# Altium project RF_Tetra.PrjPcb (part 4 of 7)

## Sheet RF_ANT.SchDoc: Antenna
size A3; SheetNumber: 13; SheetTotal: 17
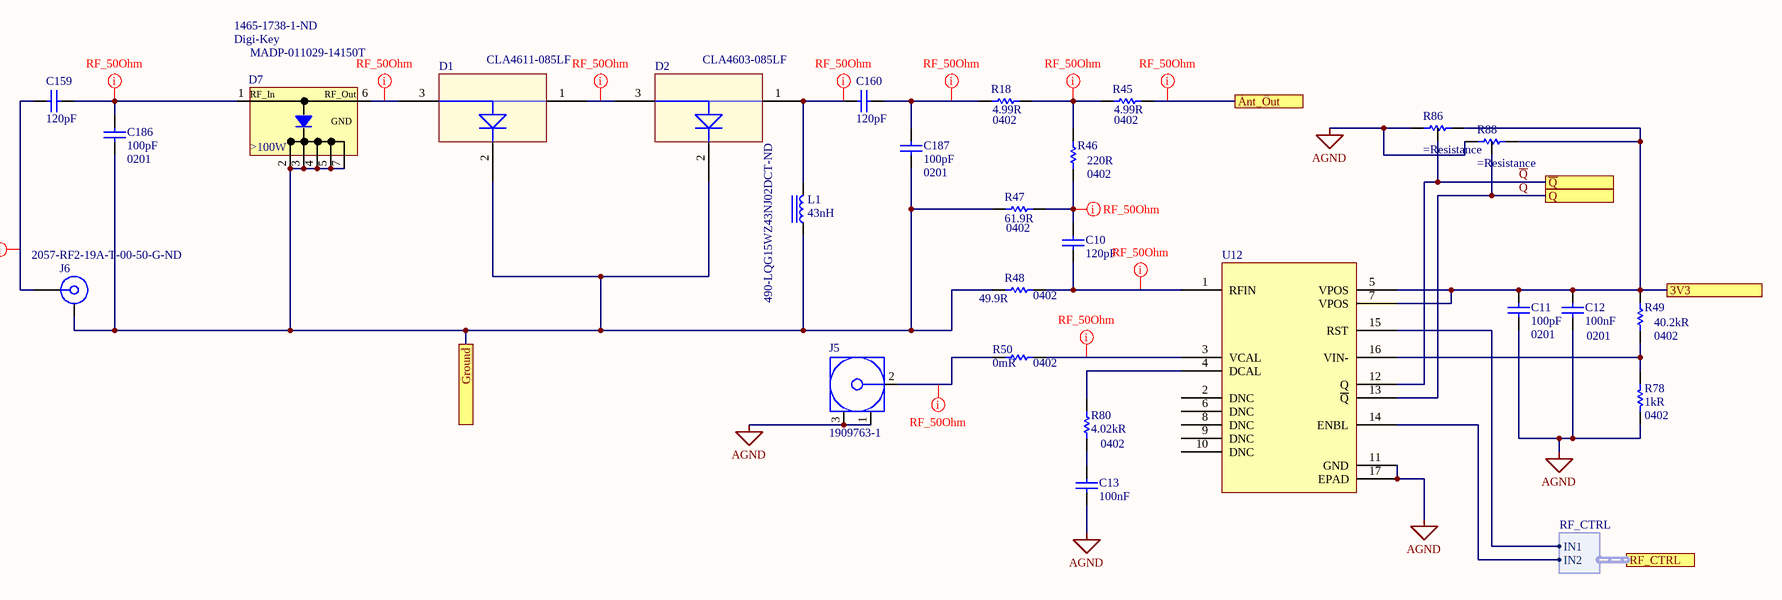
[diagram p8: RF_ANT.SchDoc]

### Parts
(Parts that share a designator on the sheet are numbered #1, #2 ... from top to bottom, then left to right.)
C10#2  120pF  [CAP 0402/1005 RF KK]
C11#2  100pF  Case/Package: 0201  [CAP 0201/0603 KK]
C12#2  100nF  Case/Package: 0201  [CAP 0201/0603 KK]
C13#2  100nF  [CAP 0201/0603 KK]
C159  120pF  [CAP 0402/1005 RF KK]
C160  120pF  [CAP 0402/1005 RF KK]
C186  100pF  Case/Package: 0201  [CAP 0201/0603 KK]
C187  100pF  Case/Package: 0201  [CAP 0201/0603 KK]
D1  CLA4611-085LF  [CLA4611-085LF]
D2  CLA4603-085LF  [CLA4611-085LF]
D7  MADP-011029-14150T  Supplier 1: Digi-Key  Supplier Part Number 1: 1465-1738-1-ND  [ODS-1415]
J5  1909763-1  [TECO-1909763-1_V]
J6  Supplier Part Number 1: 2057-RF2-19A-T-00-50-G-ND  [ROS-32K101-400L5_V]  (hidden comment: 32K101-400L5)
L1  43nH  Supplier Part Number 1: 490-LQG15WZ43NJ02DCT-ND  [IND 0402/1005 RF WW]
R18  4.99R  Case/Package: 0402  [RES 0402/1005 RF KK]
R45  4.99R  Case/Package: 0402  [RES 0402/1005 RF KK]
R46  220R  Case/Package: 0402  [RES 0402/1005 RF KK]
R47  61.9R  Case/Package: 0402  [RES 0402/1005 RF KK]
R48  49.9R  Case/Package: 0402  [RES 0402/1005 RF KK]
R49  40.2kR  Case/Package: 0402  [RES 0402/1005 RF KK]
R50  0mR  Case/Package: 0402  [RES 0402/1005 RF KK]
R78  1kR  Case/Package: 0402  [RES 0402/1005 RF KK]
R80  4.02kR  Case/Package: 0402  [RES 0402/1005 RF KK]
R86  (no value)  [RES 0402/1005 RF - 3-PADS]
R88  (no value)  [RES 0402/1005 RF - 3-PADS]
U12  ADL5910ACPZN-R7  [ADL5910]  (value not drawn)

### Ports
3V3, Ant_Out, Ground, Q, RF_CTRL (harness RF_CTRL), ~{Q}

### Harnesses
RF_CTRL: IN1, IN2

### Nets
AGND: C11#2.2 C12#2.1 C13#2.1 C186.1 C187.1 D1.2(GND) D2.2(GND) D7.2(GND) D7.3(GND) D7.4(GND) D7.5(GND) D7.7(GND) J5.1 J5.3 J6.MH L1.1 R47.1 R48.2 R78.2 R86.2 R88.2 U12.11(GND) U12.17(EPAD) ; port Ground  [project net GND_ATT]
3V3_DIGIT: C11#2.1 C12#2.2 R49.2 R86.1 R88.1 U12.5(VPOS) U12.7(VPOS) ; port 3V3
EN_RF_P_1: U12.14(ENBL) ; port RF_CTRL.IN2
Q: R88.3 U12.13(~{Q}) ; port Q
~{Q}: R86.3 U12.12(Q) ; port ~{Q}
RST_RF_P_1: U12.15(RST) ; port RF_CTRL.IN1
NetC10#2_1: C10#2.1 R48.1 U12.1(RFIN)
NetC10#2_2: C10#2.2 R46.2 R47.2
NetC13#2_2: C13#2.2 R80.1
NetC159_1: C159.1 J6.1
NetC159_2: C159.2 C186.2 D7.1(RF_In)
NetC160_1: C160.1 D2.1 L1.2
NetC160_2: C160.2 C187.2 R18.1
NetD1_1: D1.1 D2.3
NetD1_3: D1.3 D7.6(RF_Out)
NetJ5_2: J5.2 R50.1
NetR18_2: R18.2 R45.1 R46.1
NetR45_2: R45.2 ; port Ant_Out
NetR49_1: R49.1 R78.1 U12.16(VIN-)
NetR50_2: R50.2 U12.3(VCAL)
NetR80_2: R80.2 U12.4(DCAL)

Not connected (* = marked no-connect by the designer): U12 2(DNC) 6(DNC) 8(DNC) 9(DNC) 10(DNC)

### Layout directives
net class Single50: NetC10#2_1, NetC10#2_2, NetC159_1, NetC159_2, NetC160_1, NetC160_2, NetD1_1, NetD1_3, NetJ5_2, NetR18_2, NetR45_2, NetR50_2

### Notes on the sheet
- Title
- Size:
- Date:
- A3
- Number:
- Time:
- Revision:
- Sheet
- of
- File:
- (in symbol MADP-011029-14150T) >100W

### Library data of the parts
C10#2 C159 C160 = Capacitor: CAP CER 120PF 25V C0G/NP0 0402; Manufacturer: KEMET; Manufacturer Part Number: C0402C121J3GAC7867; Tolerance: 5%; Supplier 1: Digi-Key; Supplier Part Number 1: 399-14880-1-ND; RoHS: No; Category: Ceramic Capacitors; Stock 1: 43311; Pricing 1: 1=0,10000, 10=0,04100, 50=0,02260, 100=0,01840, 500=0,01312, 1000=0,01032, 2500=0,00938, 5000=0,00863 (USD); Mount: Surface Mount; Case/Package: 0402; Case Code (Imperial): 0402; Case Code (Metric): 1005; Min Operating Temperature: -55°C; Max Operating Temperature: 125°C; Packaging: Tape and Reel; Capacitance: 120pF; Voltage Rating: 25V; ComponentLink1URL: https://api.kemet.com/component-edge/download/datasheet/C0402C121J3GAC7867.pdf?src-supplier=Digi-Key; ComponentLink1Description: https://api.kemet.com/component-edge/download/datasheet/C0402C121J3GAC7867.pdf?src-supplier=Digi-Key
C11#2 C186 C187 = Capacitor: Multilayer Ceramic Capacitors MLCC - SMD/SMT 0201 100pF 25volts C0G +/-5%; Manufacturer: Murata; Manufacturer Part Number: GRM0335C1E101JA01D; Tolerance: 5%; Voltage: 25V; Supplier 1: Digi-Key; Supplier Part Number 1: 490-3160-1-ND; RoHS: Yes; Category: Ceramic Capacitors; Stock 1: 270262; Pricing 1: 1=0,10000, 10=0,01300, 100=0,00560, 500=0,00400, 1000=0,00315, 2500=0,00286, 5000=0,00263 (USD); Mount: Surface Mount; Case Code (Metric): 0603; Case Code (Imperial): 0201; Min Operating Temperature: -55°C; Max Operating Temperature: 125°C; Dielectric: C0G; Capacitance: 100pF; Termination: SMD/SMT; Package Quantity: 15000; Packaging: Tape and Reel; Voltage Rating: 25V; Voltage Rating (DC): 25V; Length: 0.6mm; Height: 0.3mm; Thickness: 0.013inch; Depth: 0.3mm; Width: 0.012inch; Radiation Hardening: No; REACH SVHC: No SVHC; Lead Free: Lead Free; ComponentLink1URL: https://datasheet.ciiva.com/16497/grm0335c1e101ja01-01-16497112.pdf?src-supplier=Future+Electronics; ComponentLink1Description: https://datasheet.ciiva.com/16497/grm0335c1e101ja01-01-16497112.pdf?src-supplier=Future+Electronics; ComponentLink2URL: https://datasheet.ciiva.com/18697/product-18697797.pdf?src-supplier=Digi-Key; ComponentLink2Description: https://datasheet.ciiva.com/18697/product-18697797.pdf?src-supplier=Digi-Key
C12#2 C13#2 = Capacitor: Manufacturer 1: Murata; Manufacturer Part Number 1: GRM033R61C104ME84D; Voltage Rating: 16V; Tolerance: 20%; Dielectric: X5R; Supplier 1: Digi-Key; Supplier Part Number 1: 490-9986-1-ND; Stock 1: 503570; Pricing 1: 1=0.10000, 10=0.05400, 100=0.02430, 500=0.01732, 1000=0.01361, 2500=0.01238, 5000=0.01139 (USD); RoHS: Yes; Mount: Surface Mount; Weight: 1.2E-05oz; Case Code (Metric): 0603; Case Code (Imperial): 0201; Min Operating Temperature: -55°C; Max Operating Temperature: 85°C; Capacitance: 100nF; Packaging: Tape and Reel; Termination: SMD/SMT; Voltage Rating (DC): 16V; Package Quantity: 15000; Length: 0.024inch; Height: 0.3mm; Width: 0.3mm; Thickness: 0.013inch; ComponentLink1URL: http://www.mouser.com/ds/2/281/c02e-2905.pdf?src-supplier=Mouser; ComponentLink1Description: http://www.mouser.com/ds/2/281/c02e-2905.pdf?src-supplier=Mouser; ComponentLink2URL: http://search.murata.co.jp/Ceramy/image/img/A01X/G101/ENG/GRM033R61C104ME84-01.pdf?src-supplier=Digi-Key; ComponentLink2Description: http://search.murata.co.jp/Ceramy/image/img/A01X/G101/ENG/GRM033R61C104ME84-01.pdf?src-supplier=Digi-Key
  C13#2: Case/Package: 0201
D1 = CLA4611-085LF: Diode PIN 180V 1500mA 3-Pin QFN EP T/R; Manufacturer: Skyworks Solutions; Diode Type: PIN - Single; Max Current Rating: 1.5A; Max Power Dissipation: 2W; Supplier 1: Digi-Key; Manufacturer Part Number: CLA4611-085LF; RoHS: Yes; Category: Diodes; Stock 1: 1259; Pricing 1: 1=2,06000, 10=1,85200, 25=1,74760, 100=1,48890, 250=1,39800, 500=1,22326, 1000=1,01355 (USD); Case/Package: QFN; Packaging: Tape and Reel; ComponentLink1URL: http://www.mouser.com/ds/2/472/CLA4611_085LF_203346B-1079479.pdf?src-supplier=Mouser; ComponentLink1Description: http://www.mouser.com/ds/2/472/CLA4611_085LF_203346B-1079479.pdf?src-supplier=Mouser; ComponentLink2URL: http://www.skyworksinc.com/uploads/documents/CLA4611_085LF_203346B.pdf?src-supplier=Digi-Key; ComponentLink2Description: http://www.skyworksinc.com/uploads/documents/CLA4611_085LF_203346B.pdf?src-supplier=Digi-Key
D2 = CLA4603-085LF: DIODE RF PIN 45V 1.5A 3QFN; Manufacturer: Skyworks Solutions; Diode Type: PIN - Single; Power Dissipation: 30W; Max Power Dissipation: 2W; Element Configuration: Common Anode; Supplier 1: Digi-Key; Manufacturer Part Number: CLA4603-085LF; RoHS: Yes; Category: Diodes; Stock 1: 32861; Pricing 1: 1=2,06000, 10=1,85200, 25=1,74760, 100=1,48890, 250=1,39800, 500=1,22326, 1000=1,01355 (USD); Mount: Surface Mount; Case/Package: QFN; Number of Pins: 3; Min Operating Temperature: -40°C; Max Operating Temperature: 150°C; Termination: SMD/SMT; Max Current Rating: 1.5A; Reverse Voltage (DC): 45V; Packaging: Tape and Reel; Package Quantity: 3000; Forward Current: 1.5A; Radiation Hardening: No; Lead Free: Lead Free; ComponentLink1URL: https://datasheet.ciiva.com/15224/getdatasheetpartid-729048-15224693.pdf?src-supplier=Verical; ComponentLink1Description: https://datasheet.ciiva.com/15224/getdatasheetpartid-729048-15224693.pdf?src-supplier=Verical
J5 = 1909763-1: Ultra Miniature Coaxial Connector Jack, 60 V, 50 Ohm, -40 to 90 degC, RoHS, Tape and Reel; Brand: TE Connectivity / AMP; Maximum Frequency: 6 GHz; Gender: Jack (Female); Body Material: Liquid Crystal Polymer (LCP); RF Series: UMCC; Impedance: 50 Ohms; DatasheetVersion: Rev. B2; PackageReference: SMD; PackageDescription: 3-Pin Surface Mount Device, Body 2.6 x 2.6 mm; Supplier 1: Newark; Supplier Part Number 1: 62X0488; Supplier 2: Farnell; Supplier Part Number 2: 2781689; Supplier 3: Digi-Key; Supplier Part Number 3: A118077TR-ND; Supplier 4: Digi-Key; Supplier Part Number 4: A118077CT-ND; Supplier 5: Digi-Key; Supplier Part Number 5: A118077DKR-ND; Product Category: RF Connectors / Coaxial Connectors; Packaging: Reel; Product: Connectors; Orientation: Straight; Operating Temperature Range: - 40 C to + 90 C; Factory Pack Quantity: 5000; RoHS: Details; Contact Plating: Gold; Contact Material: Copper Alloy; Mounting Technology: Surface Mount; ComponentLink1Description: Manufacturer URL; ComponentLink1URL: http://www.te.com; ComponentLink2Description: Datasheet; ComponentLink2URL: http://www.te.com/commerce/DocumentDelivery/DDEController?Action=srchrtrv&DocNm=1909763&DocType=Customer+Drawing&DocLang=English
J6 = 32K101-400L5: SMA Straight Jack, Up to 18 GHz, -55 to 155 degC; Manufacturer: Adam Equipment; Manufacturer Part Number: RF2-19A-T-00-50-G; Supplier 1: Digi-Key; RoHS: No; Stock 1: 329; Pricing 1: 1=2,90000, 10=2,78800, 25=2,55520, 50=2,43920, 100=2,32300, 250=2,03264, 500=1,97456, 1000=1,68418, 2500=1,56802 (USD)
L1 = IND_WW: Inductor Chip 43nH 5% 2-Pin 0402 Paper T/R; Manufacturer: Murata; Manufacturer Part Number: LQG15WZ43NJ02D; Supplier 1: Digi-Key; Stock 1: 10000; Pricing 1: 1=0,13000, 10=0,11700, 25=0,10400, 50=0,08840, 100=0,07800, 250=0,07152, 500=0,06500, 1000=0,05460, 2500=0,04680 (USD); ComponentLink1URL: http://datasheet.octopart.com/LQG15WZ43NJ02D-Murata-datasheet-138753957.pdf?src-supplier=Ciiva+Crawler; ComponentLink1Description: http://datasheet.octopart.com/LQG15WZ43NJ02D-Murata-datasheet-138753957.pdf?src-supplier=Ciiva+Crawler; ComponentLink2URL: http://datasheet.octopart.com/LQG15WZ43NJ02D-Murata-datasheet-140712826.pdf?src-supplier=Ciiva+Crawler; ComponentLink2Description: http://datasheet.octopart.com/LQG15WZ43NJ02D-Murata-datasheet-140712826.pdf?src-supplier=Ciiva+Crawler; ComponentLink3URL: http://datasheet.octopart.com/LQG15WZ43NJ02D-Murata-datasheet-141286732.pdf?src-supplier=Ciiva+Crawler; ComponentLink3Description: http://datasheet.octopart.com/LQG15WZ43NJ02D-Murata-datasheet-141286732.pdf?src-supplier=Ciiva+Crawler; ComponentLink4URL: http://datasheet.octopart.com/LQG15WZ43NJ02D-Murata-datasheet-145449678.pdf?src-supplier=Geoflip; ComponentLink4Description: http://datasheet.octopart.com/LQG15WZ43NJ02D-Murata-datasheet-145449678.pdf?src-supplier=Geoflip
R18 R45 = Resistor: RES SMD 4.99 OHM 1% 1/16W 0402; Manufacturer: Vishay; Manufacturer Part Number: CRCW04024R99FKEDC; Max Power Dissipation: 63mW; Temperature Coefficient: 100ppm/°C; Supplier 1: Digi-Key; Supplier Part Number 1: 541-4085-1-ND; RoHS: No; Stock 1: 341364; Pricing 1: 1=0,10000, 10=0,09300, 100=0,03580, 1000=0,01573, 2500=0,01358, 5000=0,01216 (USD); Case Code (Imperial): 0402; Case Code (Metric): 1005; Min Operating Temperature: -55°C; Max Operating Temperature: 155°C; Composition: Thick Film; Packaging: Tape and Reel; Resistance: 4.99R; Tolerance: 1%; Number of Terminations: 2; ComponentLink1URL: http://www.vishay.com/docs/28773/crcwce3.pdf?src-supplier=Digi-Key; ComponentLink1Description: http://www.vishay.com/docs/28773/crcwce3.pdf?src-supplier=Digi-Key
R46 = Resistor: TE CONNECTIVITY - CRGP0402F220R - SMD Chip Resistor, 0402 [1005 Metric], 220 ohm, CRGP Series, 50 V, Thick Film, 125 mW; Tolerance: 1%; Max Power Dissipation: 125mW; Temperature Coefficient: 100ppm/°C; Supplier 1: Digi-Key; Supplier Part Number 1: A130347CT-ND; Manufacturer: TE Connectivity; Manufacturer Part Number: CRGP0402F220R; RoHS: No; Category: Chip SMD Resistors; Stock 1: 193172; Pricing 1: 1=0,10000, 10=0,08400, 100=0,03230, 1000=0,01421, 2500=0,01228, 5000=0,01098 (USD); Min Operating Temperature: -55°C; Max Operating Temperature: 155°C; Resistor Type: Thick Film; Packaging: Tape and Reel; Resistance: 220R; Number of Terminations: 2; ComponentLink1URL: https://www.te.com/commerce/DocumentDelivery/DDEController?Action=srchrtrv&DocNm=9-1773463-9&DocType=DS&DocLang=English&src-supplier=Digi-Key; ComponentLink1Description: https://www.te.com/commerce/DocumentDelivery/DDEController?Action=srchrtrv&DocNm=9-1773463-9&DocType=DS&DocLang=English&src-supplier=Digi-Key; ComponentLink2URL: https://4donline.ihs.com/images/VipMasterIC/IC/TYEL/TYEL-S-A0005460475/TYEL-S-A0005460475-1.pdf?hkey=52A5661711E402568146F3353EA87419&src-supplier=Farnell; ComponentLink2Description: https://4donline.ihs.com/images/VipMasterIC/IC/TYEL/TYEL-S-A0005460475/TYEL-S-A0005460475-1.pdf?hkey=52A5661711E402568146F3353EA87419&src-supplier=Farnell; ComponentLink3URL: https://4donline.ihs.com/images/VipMasterIC/IC/TYEL/TYEL-S-A0005460475/TYEL-S-A0005460475-1.pdf?hkey=52A5661711E402568146F3353EA87419&src-supplier=Newark; ComponentLink3Description: https://4donline.ihs.com/images/VipMasterIC/IC/TYEL/TYEL-S-A0005460475/TYEL-S-A0005460475-1.pdf?hkey=52A5661711E402568146F3353EA87419&src-supplier=Newark
R47 = Resistor: RES SMD 61.9 OHM 1% 1/16W 0402; Manufacturer: Yageo; Manufacturer Part Number: RC0402FR-0761R9L; Power Rating: 62.5mW; Voltage Rating: 50V; Temperature Coefficient: 100ppm/°C; Max Power Dissipation: 63mW; Supplier 1: Digi-Key; Supplier Part Number 1: 311-61.9LRCT-ND; RoHS: Yes; Category: Chip SMD Resistors; Stock 1: 87319; Pricing 1: 1=0,10000, 10=0,01400, 100=0,00580, 1000=0,00262, 2500=0,00228, 5000=0,00188 (USD); Case Code (Imperial): 0402; Case Code (Metric): 1005; Contact Plating: Tin,Matte,Lead; Min Operating Temperature: -55°C; Max Operating Temperature: 155°C; Package Quantity: 1; Resistance: 61.9R; Tolerance: 1%; Packaging: Tape and Reel; Termination: SMD/SMT; Resistor Type: Thick Film; Number of Terminations: 2; Voltage Rating (DC): 50V; Working Voltage: 50V; Features: Moisture Resistant; Length: 1mm; Width: 0.5mm; Height: 0.016inch; Depth: 0.5mm; Radiation Hardening: No; Military Standard: Not; Lead Free: Lead Free; ComponentLink1URL: https://datasheet.ciiva.com/16741/pyu-rc0402-51-rohs-l-6-r-16741941.pdf?src-supplier=Future+Electronics; ComponentLink1Description: https://datasheet.ciiva.com/16741/pyu-rc0402-51-rohs-l-6-r-16741941.pdf?src-supplier=Future+Electronics; ComponentLink2URL: https://datasheet.ciiva.com/15189/getdatasheetpartid-325045-15189495.pdf?src-supplier=Verical; ComponentLink2Description: https://datasheet.ciiva.com/15189/getdatasheetpartid-325045-15189495.pdf?src-supplier=Verical; ComponentLink3URL: https://datasheet.ciiva.com/2453/pyu-r-int-thick-7-2453706.pdf?src-supplier=Digi-Key; ComponentLink3Description: https://datasheet.ciiva.com/2453/pyu-r-int-thick-7-2453706.pdf?src-supplier=Digi-Key; ComponentLink4URL: https://datasheet.ciiva.com/2453/pyu-r-int-thick-7-2453707.pdf?src-supplier=Digi-Key; ComponentLink4Description: https://datasheet.ciiva.com/2453/pyu-r-int-thick-7-2453707.pdf?src-supplier=Digi-Key; ComponentLink5URL: https://datasheet.ciiva.com/16867/pyu-rc0402-51-rohs-l-6-16867419.pdf?src-supplier=Avnet+Europe; ComponentLink5Description: https://datasheet.ciiva.com/16867/pyu-rc0402-51-rohs-l-6-16867419.pdf?src-supplier=Avnet+Europe; ComponentLink6URL: https://datasheet.ciiva.com/2453/pyu-r-int-thick-7-2453708.pdf?src-supplier=Digi-Key; ComponentLink6Description: https://datasheet.ciiva.com/2453/pyu-r-int-thick-7-2453708.pdf?src-supplier=Digi-Key; ComponentLink7URL: https://datasheet.ciiva.com/28397/pyu-rc0402-51-rohs-l-6-28397965.pdf?src-supplier=Avnet+Europe; ComponentLink7Description: https://datasheet.ciiva.com/28397/pyu-rc0402-51-rohs-l-6-28397965.pdf?src-supplier=Avnet+Europe; ComponentLink8URL: https://datasheet.ciiva.com/8888/pyu-rc0402-51-rohs-l-6-8888591.pdf?src-supplier=Avnet; ComponentLink8Description: https://datasheet.ciiva.com/8888/pyu-rc0402-51-rohs-l-6-8888591.pdf?src-supplier=Avnet
R48 = Resistor: SUSUMU - RR0510R-49R9-D - RES, THIN FILM, 49R9, 0.5%, 0.0625W, 0402; Voltage Rating (DC): 25V; Power Rating: 62.5mW; Temperature Coefficient: 100ppm/°C; Supplier 1: Digi-Key; Supplier Part Number 1: RR05R49.9DCT-ND; Manufacturer: Susumu; Manufacturer Part Number: RR0510R-49R9-D; RoHS: Yes; Category: Chip SMD Resistors; Stock 1: 493315; Pricing 1: 1=0,10000, 10=0,07200, 100=0,02910, 1000=0,01309, 2500=0,01136, 5000=0,00939 (USD); Number of Pins: 2; Case Code (Imperial): 0402; Case Code (Metric): 1005; Min Operating Temperature: -55°C; Max Operating Temperature: 125°C; Tolerance: 0.5%; Packaging: Tape and Reel; Resistance: 49.9R; Voltage Rating: 25V; Termination: SMD/SMT; Resistor Type: Thin Film; Length: 1mm; Width: 0.5mm; Height: 0.35mm; Lead Free: Lead Free; REACH SVHC: Unknown; ComponentLink1URL: https://datasheet.ciiva.com/7984/1581132-7984319.pdf?src-supplier=Element14; ComponentLink1Description: https://datasheet.ciiva.com/7984/1581132-7984319.pdf?src-supplier=Element14
R49 = Resistor: Res Thick Film 0402 40.2K Ohm 1% 1/16W ±100ppm/°C Molded SMD Paper T/R; Manufacturer: Yageo; Manufacturer Part Number: RC0402FR-0740K2L; Power Rating: 62.5mW; Voltage Rating: 50V; Max Power Dissipation: 63mW; Supplier 1: Digi-Key; Supplier Part Number 1: 311-40.2KLRCT-ND; RoHS: Yes; Category: Chip SMD Resistors; Stock 1: 625093; Pricing 1: 1=0,10000, 10=0,01400, 100=0,00580, 1000=0,00262, 2500=0,00228, 5000=0,00188 (USD); Case Code (Metric): 1005; Case Code (Imperial): 0402; Contact Plating: Tin,Matte; Min Operating Temperature: -55°C; Max Operating Temperature: 155°C; Package Quantity: 1; Resistance: 40.2kR; Tolerance: 1%; Packaging: Tape and Reel; Resistor Type: Thick Film; Number of Terminations: 2; Termination: SMD/SMT; Temperature Coefficient: 100ppm/°C; Features: Moisture Resistant; Voltage Rating (DC): 50V; Length: 0.039inch; Width: 0.02inch; Height: 0.016inch; Depth: 0.5mm; Military Standard: Not; Lead Free: Lead Free; ComponentLink1URL: https://datasheet.ciiva.com/8889/pyu-rc0402-51-rohs-l-6-8889263.pdf?src-supplier=Avnet; ComponentLink1Description: https://datasheet.ciiva.com/8889/pyu-rc0402-51-rohs-l-6-8889263.pdf?src-supplier=Avnet; ComponentLink2URL: https://datasheet.ciiva.com/16857/pyu-rc0402-51-rohs-l-6-16857071.pdf?src-supplier=Avnet+Europe; ComponentLink2Description: https://datasheet.ciiva.com/16857/pyu-rc0402-51-rohs-l-6-16857071.pdf?src-supplier=Avnet+Europe; ComponentLink3URL: https://datasheet.ciiva.com/28400/pyu-rc0402-51-rohs-l-6-28400199.pdf?src-supplier=Avnet+Europe; ComponentLink3Description: https://datasheet.ciiva.com/28400/pyu-rc0402-51-rohs-l-6-28400199.pdf?src-supplier=Avnet+Europe; ComponentLink4URL: https://datasheet.ciiva.com/2453/pyu-r-int-thick-7-2453436.pdf?src-supplier=Digi-Key; ComponentLink4Description: https://datasheet.ciiva.com/2453/pyu-r-int-thick-7-2453436.pdf?src-supplier=Digi-Key; ComponentLink5URL: https://datasheet.ciiva.com/2453/pyu-r-int-thick-7-2453437.pdf?src-supplier=Digi-Key; ComponentLink5Description: https://datasheet.ciiva.com/2453/pyu-r-int-thick-7-2453437.pdf?src-supplier=Digi-Key; ComponentLink6URL: https://datasheet.ciiva.com/5557/pyu-rc0402-51-rohs-l-6-r-5557981.pdf?src-supplier=Mouser; ComponentLink6Description: https://datasheet.ciiva.com/5557/pyu-rc0402-51-rohs-l-6-r-5557981.pdf?src-supplier=Mouser; ComponentLink7URL: https://datasheet.ciiva.com/2453/pyu-r-int-thick-7-2453438.pdf?src-supplier=Digi-Key; ComponentLink7Description: https://datasheet.ciiva.com/2453/pyu-r-int-thick-7-2453438.pdf?src-supplier=Digi-Key; ComponentLink8URL: https://datasheet.ciiva.com/16744/pyu-rc0402-51-rohs-l-6-r-16744286.pdf?src-supplier=Future+Electronics; ComponentLink8Description: https://datasheet.ciiva.com/16744/pyu-rc0402-51-rohs-l-6-r-16744286.pdf?src-supplier=Future+Electronics
R50 = Resistor: YAGEO - RC0402JR-070RL. - RES, THICK FILM, 0R, 0.0625W, 0402; Power Rating: 62.5mW; Tolerance: 5%; Voltage Rating: 50V; Max Power Dissipation: 63mW; Temperature Coefficient: 200ppm/°C; Supplier 1: Digi-Key; Supplier Part Number 1: 311-0.0JRCT-ND; Manufacturer: Yageo; Manufacturer Part Number: RC0402JR-070RL; RoHS: Yes; Category: Chip SMD Resistors; Stock 1: 45338179; Pricing 1: 1=0,10000, 10=0,01200, 25=0,00920, 50=0,00680, 100=0,00510, 250=0,00388, 500=0,00310, 1000=0,00228, 5000=0,00163 (USD); Case Code (Metric): 1005; Case Code (Imperial): 0402; Contact Plating: Tin,Matte; Min Operating Temperature: -55°C; Max Operating Temperature: 155°C; Package Quantity: 1; Resistance: 0mR; Packaging: Tape and Reel; Resistor Type: Thick Film; Number of Terminations: 2; Termination: SMD/SMT; Features: Moisture Resistant; Length: 1mm; Height: 0.016inch; Width: 0.02inch; Depth: 0.5mm; Radiation Hardening: No; REACH SVHC: Unknown; Military Standard: Not; Lead Free: Lead Free; ComponentLink1URL: https://datasheet.ciiva.com/2452/pyu-rc0402-51-rohs-l-6-2452608.pdf?src-supplier=Digi-Key; ComponentLink1Description: https://datasheet.ciiva.com/2452/pyu-rc0402-51-rohs-l-6-2452608.pdf?src-supplier=Digi-Key; ComponentLink2URL: https://datasheet.ciiva.com/11808/0900766b80c66297-11808195.pdf?src-supplier=RSComponents; ComponentLink2Description: https://datasheet.ciiva.com/11808/0900766b80c66297-11808195.pdf?src-supplier=RSComponents; ComponentLink3URL: https://datasheet.ciiva.com/2452/pyu-r-int-thick-7-2452609.pdf?src-supplier=Digi-Key; ComponentLink3Description: https://datasheet.ciiva.com/2452/pyu-r-int-thick-7-2452609.pdf?src-supplier=Digi-Key; ComponentLink4URL: https://datasheet.ciiva.com/2452/pyu-r-int-thick-7-2452610.pdf?src-supplier=Digi-Key; ComponentLink4Description: https://datasheet.ciiva.com/2452/pyu-r-int-thick-7-2452610.pdf?src-supplier=Digi-Key; ComponentLink5URL: https://datasheet.ciiva.com/8896/pyu-rc0402-51-rohs-l-6-8896201.pdf?src-supplier=Avnet; ComponentLink5Description: https://datasheet.ciiva.com/8896/pyu-rc0402-51-rohs-l-6-8896201.pdf?src-supplier=Avnet; ComponentLink6URL: https://datasheet.ciiva.com/28386/pyu-rc0402-51-rohs-l-6-28386633.pdf?src-supplier=Avnet+Europe; ComponentLink6Description: https://datasheet.ciiva.com/28386/pyu-rc0402-51-rohs-l-6-28386633.pdf?src-supplier=Avnet+Europe; ComponentLink7URL: https://datasheet.ciiva.com/22747/1018594-22747515.pdf?src-supplier=Element14; ComponentLink7Description: https://datasheet.ciiva.com/22747/1018594-22747515.pdf?src-supplier=Element14; ComponentLink8URL: https://datasheet.ciiva.com/15189/getdatasheetpartid-326379-15189533.pdf?src-supplier=Verical; ComponentLink8Description: https://datasheet.ciiva.com/15189/getdatasheetpartid-326379-15189533.pdf?src-supplier=Verical
R78 = Resistor: Manufacturer 1: Yageo; Manufacturer Part Number 1: RC0402FR-071KL; Tolerance: 1%; Temperature Coefficient: 100ppm/°C; Power Rating: 62.5mW; Voltage Rating: 50V; Supplier 1: Digi-Key; Supplier Part Number 1: 311-1.00KLRCT-ND; Stock 1: 57541929; Pricing 1: 1=0,10000, 10=0,01600, 100=0,00640, 1000=0,00289, 2500=0,00251, 5000=0,00207 (USD); RoHS: Yes; Number of Pins: 2; Case Code (Imperial): 0402; Case Code (Metric): 1005; Min Operating Temperature: -55°C; Max Operating Temperature: 155°C; Packaging: Tape and Reel; Resistance: 1kR; Composition: Thick Film; Voltage Rating (DC): 50V; Termination: SMD/SMT; Military Standard: Not; Length: 1mm; Height: 0.32mm; Width: 0.5mm; Depth: 0.5mm; REACH SVHC: Unknown; Lead Free: Lead Free; ComponentLink1URL: https://datasheet.ciiva.com/11819/0900766b80c66297-11819477.pdf?src-supplier=RSComponents; ComponentLink1Description: https://datasheet.ciiva.com/11819/0900766b80c66297-11819477.pdf?src-supplier=RSComponents; ComponentLink2URL: https://datasheet.ciiva.com/12666/pyu-rc0402-51-rohs-l-6-r-12666741.pdf?src-supplier=Mouser; ComponentLink2Description: https://datasheet.ciiva.com/12666/pyu-rc0402-51-rohs-l-6-r-12666741.pdf?src-supplier=Mouser; ComponentLink3URL: https://datasheet.ciiva.com/17063/pyu-rc0402-51-rohs-l-6-r-17063193.pdf?src-supplier=Future+Electronics; ComponentLink3Description: https://datasheet.ciiva.com/17063/pyu-rc0402-51-rohs-l-6-r-17063193.pdf?src-supplier=Future+Electronics; ComponentLink4URL: https://datasheet.ciiva.com/22747/1018594-22747513.pdf?src-supplier=Element14; ComponentLink4Description: https://datasheet.ciiva.com/22747/1018594-22747513.pdf?src-supplier=Element14; ComponentLink5URL: https://datasheet.ciiva.com/7849/1018594-7849869.pdf?src-supplier=Element14; ComponentLink5Description: https://datasheet.ciiva.com/7849/1018594-7849869.pdf?src-supplier=Element14; ComponentLink6URL: https://datasheet.ciiva.com/7983/1018594-7983502.pdf?src-supplier=Element14; ComponentLink6Description: https://datasheet.ciiva.com/7983/1018594-7983502.pdf?src-supplier=Element14; ComponentLink7URL: https://datasheet.ciiva.com/7849/1018594-7849871.pdf?src-supplier=Element14; ComponentLink7Description: https://datasheet.ciiva.com/7849/1018594-7849871.pdf?src-supplier=Element14
R80 = Resistor: PANASONIC ELECTRONIC COMPONENTS - ERJ2RKF4021X - RES, THICK FILM, 4K02, 1%, 0.1W, 0402; Manufacturer Part Number: ERJ-2RKF4021X; Power Rating: 100mW; Voltage Rating: 50V; Temperature Coefficient: 100ppm/°C; Supplier 1: Digi-Key; Supplier Part Number 1: P4.02KLCT-ND; Manufacturer: Panasonic; RoHS: Yes; Category: Chip SMD Resistors; Stock 1: 51464; Pricing 1: 1=0,10000, 10=0,02200, 100=0,00890, 1000=0,00398, 2500=0,00345, 5000=0,00285 (USD); Mount: Surface Mount; Case Code (Metric): 1005; Case Code (Imperial): 0402; Contact Plating: Tin; Min Operating Temperature: -55°C; Max Operating Temperature: 155°C; Resistance: 4.02kR; Tolerance: 1%; Packaging: Tape and Reel; Package Quantity: 1; Resistor Type: Thick Film; Number of Terminations: 2; Termination: SMD/SMT; Max Power Dissipation: 100mW; Voltage Rating (DC): 50V; Features: Automotive AEC-Q200; Length: 1mm; Width: 0.02inch; Height: 0.35mm; Depth: 0.5mm; REACH SVHC: Unknown; Military Standard: Not; Lead Free: Lead Free; ComponentLink1URL: https://datasheet.ciiva.com/27055/1987273-27055653.pdf?src-supplier=Jameco; ComponentLink1Description: https://datasheet.ciiva.com/27055/1987273-27055653.pdf?src-supplier=Jameco; ComponentLink2URL: https://datasheet.ciiva.com/30122/aoa0000ce2-30122470.pdf?src-supplier=Onlinecomponents.com; ComponentLink2Description: https://datasheet.ciiva.com/30122/aoa0000ce2-30122470.pdf?src-supplier=Onlinecomponents.com; ComponentLink3URL: https://datasheet.ciiva.com/16760/70260748-16760391.pdf?src-supplier=Allied+Electronics; ComponentLink3Description: https://datasheet.ciiva.com/16760/70260748-16760391.pdf?src-supplier=Allied+Electronics; ComponentLink4URL: https://datasheet.ciiva.com/28548/1678782-28548279.pdf?src-supplier=Element14; ComponentLink4Description: https://datasheet.ciiva.com/28548/1678782-28548279.pdf?src-supplier=Element14; ComponentLink5URL: https://datasheet.ciiva.com/5969/426256-5969212.pdf?src-supplier=Farnell; ComponentLink5Description: https://datasheet.ciiva.com/5969/426256-5969212.pdf?src-supplier=Farnell; ComponentLink6URL: https://datasheet.ciiva.com/24027/aoa0000ce2-24027356.pdf?src-supplier=Mouser; ComponentLink6Description: https://datasheet.ciiva.com/24027/aoa0000ce2-24027356.pdf?src-supplier=Mouser; ComponentLink7URL: https://datasheet.ciiva.com/46388/426256-46388156.pdf?src-supplier=Element14; ComponentLink7Description: https://datasheet.ciiva.com/46388/426256-46388156.pdf?src-supplier=Element14
R86 R88 = Resistor
U12 = ADL5910ACPZN-R7: RF Detector 0MHz to 6000MHz 16-Pin LFCSP EP T/R; Manufacturer: Analog Devices; Operating Supply Current: 4mA; Supplier 1: Digi-Key; Manufacturer Part Number: ADL5910ACPZN-R7; RoHS: No; Category: RF Semiconductors and Devices; Stock 1: 1503; Pricing 1: 1=5,17000, 10=4,64100, 25=4,38760, 100=3,80250, 250=3,60752, 500=3,23700 (USD); Number of Pins: 16; Packaging: Cut Tape; ComponentLink1URL: https://www.analog.com/media/en/technical-documentation/data-sheets/ADL5910.pdf?src-supplier=Digi-Key; ComponentLink1Description: https://www.analog.com/media/en/technical-documentation/data-sheets/ADL5910.pdf?src-supplier=Digi-Key; Supplier Part Number 1: ADL5910ACPZN-R7CT-ND
D7 = MADP-011029-14150T: Part Number: MADP-011029-14150T